# Altium project gocart.PrjPcb
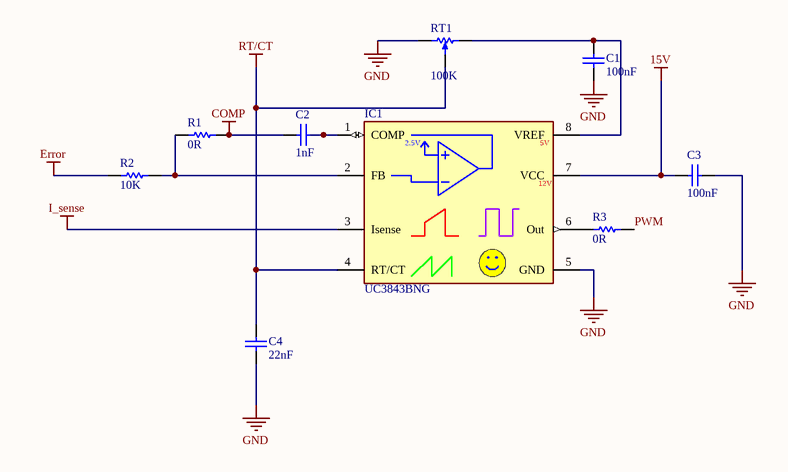
[diagram p0: current_mode_controller.SchDoc]
8 sheets, 87 parts. Net scope: global (net labels, ports and power ports of the same name join across sheets).
Board file: gocart.PcbDoc
Sheets:
  current_mode_controller.SchDoc
  volt_regulators.SchDoc
  brake_circuit.SchDoc
  accelerator.SchDoc
  i_sense.SchDoc
  test_points.SchDoc
  headers.SchDoc
  pwm_inverter.SchDoc

## Sheet current_mode_controller.SchDoc
size A4; SheetNumber: 1; SheetTotal: 8

### Parts
C1  100nF  [CAPC1608L]
C2  1nF  [CAPC1608L]
C3  100nF  [CAPC1608L]
C4  22nF  [CAPC1608L]
IC1  UC3843BNG  [DIP794W56P254L959H533Q8B]
R1  0R  [RESC1608L]
R2  10K  [RESC1608L]
R3  0R  [RESC1608L]
RT1  100K  [PVZ2A]

### Nets
15V: C3.1 IC1.7(VCC)
COMP: C2.1 R1.2
Error: R2.1
GND: C1.1 C3.2 C4.1 IC1.5(GND) RT1.3(-)
I_sense: IC1.3(Isense)
PWM: R3.2
RT/CT: C4.2 IC1.4(RT/CT) RT1.2(W)
NetC1_2: C1.2 IC1.8(VREF) RT1.1
NetC2_2: C2.2 IC1.1(COMP)
NetIC1_2: IC1.2(FB) R1.1 R2.2
NetIC1_6: IC1.6(Out) R3.1

### Notes on the sheet
- (in symbol UC3843BNG) 2.5V; 5V; 12V

### Library data of the parts
C1 C3 = CC_100nF_0603: CAP CER 100nF X7R +-10% 50V 0603; PackageReference: 0603; Code_IPC: 1608 [0603]; Verify: *; Supplier: ECE Dept; Storage Location: PCB Assembly WS; Value: 100nF
C2 = CC_1nF_0603: CAP CER 1nF X7R +-10% 50V 0603; PackageReference: 0603; Code_IPC: 1608 [0603]; Verify: *; Supplier: ECE Dept; Storage Location: PCB Assembly WS; Value: 1nF
C4 = CC_22nF_0603: CAP CER 22nF X7R +-10% 50V 0603; PackageReference: 0603; Code_IPC: 1608 [0603]; Verify: *; Supplier: ECE Dept; Storage Location: PCB Assembly WS; Value: 22nF
IC1 = UC3843BNG: Integrated Circuit; Manufacturer_Name: ON Semiconductor; Datasheet Link: http://www.onsemi.com/pub/Collateral/UC3842B-D.PDF; Height: 5.33mm; Manufacturer_Part_Number: UC3843BNG; Arrow Part Number: UC3843BNG; Arrow Price/Stock: https://www.arrow.com/en/products/uc3843bng/on-semiconductor; Mouser Part Number: 863-UC3843BNG; Mouser Price/Stock: https://www.mouser.co.uk/ProductDetail/ON-Semiconductor/UC3843BNG?qs=xZq1yRCsb1c8CkSt0UbHMA%3D%3D
R1 R3 = RS_0R0: RES 0.0 OHM 1/10W 5% 0603 SMD; Storage Location: PCB Assembly WS; Supplier: ECE Dept; Value: 0R
R2 = RS_10K: RES 10.0K OHM 1/10W 5% 0603 SMD; Storage Location: PCB Assembly WS; Supplier: ECE Dept; Value: 10K
RT1 = RM_100K: Trim Pot SMD 100K Murata PVZ2 Series SMD; Manufacturer Part Number: PVZ2A104C04B00; Adjustment Type: Top; External Depth: 2.7; External Length / Height: 0.85; External Width: 2.1; No. of Turns: 1; Power Rating: 50; Resistor Element Material: Metal Foil; Manufacturer: MURATA; Storage Location: PCB Assembly WS; Potentiometer Mounting: SMD; Series: PVZ2; Supplier 1: Farnell; Supplier Part Number 1: 1771728; Supplier: ECE Dept; Value: 100K

## Sheet volt_regulators.SchDoc
size A4; SheetNumber: 2; SheetTotal: 8
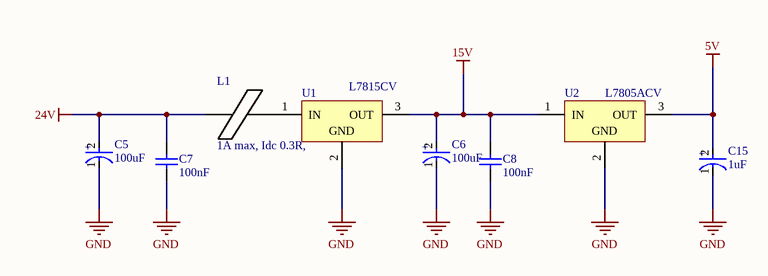
[diagram p1: volt_regulators.SchDoc]

### Parts
C5  100uF  [FP-ESLGM-MFG]
C6  100uF  [FP-ESLGM-MFG]
C7  100nF  [CAPC1608L]
C8  100nF  [CAPC1608L]
C15  1uF  [FP-UPW1E220MDD-MFG]
L1  1A max, Idc 0.3R,  [INDC3216L]
U1  L7815CV  [TO220]
U2  L7805ACV  [TO220]

### Nets
5V: C15.2(A) U2.3(OUT)
15V: C6.2(A) C8.2 U1.3(OUT) U2.1(IN)
24V: C5.2(A) C7.2 L1.1
GND: C5.1(C) C6.1(C) C7.1 C8.1 C15.1(C) U1.2(GND) U2.2(GND)
NetL1_2: L1.2 U1.1(IN)

### Notes on the sheet
- (in symbol CMP-03015-000005-1) +
- (in symbol CMP-12462-000010-1) +

### Library data of the parts
C5 C6 = CMP-03015-000005-1: CAP ALUM 100UF 20% 50V THRU HOLE. Part Number: ESL107M050AGMAA. Dia: 8mm.; Manufacturer: KEMET; Esr: 0.12Ω; Ripple Current: 725mA; Life: 10000Hours; Leakage Current: 50uA; Dissipation Factor: 10%; Material: Aluminum; Tolerance: 20%; Temperature Range High: +105°C; Automotive: No; Value: 100uF; Device Class L2: Capacitors; Lead Free: Yes; Octopart: https://octopart.com/esl107m050agmaa-kemet-84758890; Height: 13.5mm; ComponentLink2Description: Datasheet; Capacitance: 100uF; Package: ESLGM; RoHS: TRUE; Digikey Description: CAP ALUM 100UF 20% 50V THRU HOLE; Temperature Range Low: -40°C; Manufacturer Part Number: ESL107M050AGMAA; Device Class L1: Passive Components; Device Class L3: Aluminum Electrolytic Capacitors; Voltage Rating: 50V; Temperature: -40°C to +105°C; Category: Cap; ComponentLink2URL: https://content.kemet.com/datasheets/KEM_A4074_ESL.pdf; Manufacturer 1: KEMET; Manufacturer Part Number 1: ESL107M050AGMAA
C7 C8 = CC_100nF_0603: CAP CER 100nF X7R +-10% 50V 0603; PackageReference: 0603; Code_IPC: 1608 [0603]; Verify: *; Supplier: ECE Dept; Storage Location: PCB Assembly WS; Value: 100nF
C15 = CMP-12462-000010-1: CAP ALUM 22UF 20% 25V RADIAL. Part Number: UPW1E220MDD. Dia: 5mm.; Manufacturer: Nichicon; Leakage Current: 16.5uA; Ripple Current: 180mA; Life: 2000Hours; Dissipation Factor: 14%; Automotive Grade: Grade 2; Material: Aluminum; Voltage Rating: 25V; Device Class L1: Passive Components; ComponentLink2URL: https://products.nichicon.co.jp/en/pdf/XJA043/e-upw.pdf; Octopart: https://octopart.com/upw1e220mdd-nichicon-202818; RoHS: TRUE; Tolerance: 20%; Height: 12.5mm; Lead Free: Yes; Value: 22uF; Category: Cap; Temperature Range Low: -55°C; Device Class L3: Aluminum Electrolytic Capacitors; Package: 0; Manufacturer Part Number: UPW1E220MDD; Capacitance: 22uF; Automotive: Yes; Digikey Description: CAP ALUM 22UF 20% 25V RADIAL; Temperature: -55°C to +105°C; Device Class L2: Capacitors; ComponentLink2Description: Datasheet; Temperature Range High: +105°C; Manufacturer 1: Nichicon; Manufacturer Part Number 1: UPW1E220MDD
L1 = IN_Ferrite-Bead: Ferrite Bead, Rdc 0.3R, Z100MHZ 600R, Imax 1A, SMD 1206; Manufacturer: FAIR-RITE; Manufacturer PN: 2512066017Y1; DC Current Rating: 1; DC Resistance Max: 0.08; Ferrite Case Style: 1206 ^3216 Metric]; Frequency Range: 50MHz to 1; Impedance: 600; Impedance Tolerance: ± 25%; Supplier: ECE Dept; Storage Location: PCB Assembly WS; Ferrite Mounting: SMD; Supplier 1: Farnell; Supplier Part Number 1: 1612060; Manufacturer Part Number: 2512066017Y1; Value: 1A max, Idc 0.3R,
U1 = CMP-0244-00422-1: Positive Voltage Regulator, 15V, 3-Pin TO-220; Manufacturer 1: STMicroelectronics; ComponentLink1Description: Manufacturer URL; ComponentLink3URL: http://www.st.com/internet/com/TECHNICAL_RESOURCES/TECHNICAL_LITERATURE/PACKAGE_INFORMATION/CD00004649.pdf; ComponentLink3Description: Package Specification; ComponentLink1URL: http://www.st.com; ComponentLink2Description: Datasheet; DatasheetVersion: 16/11/2011; ComponentLink2URL: http://www.st.com/internet/com/TECHNICAL_RESOURCES/TECHNICAL_LITERATURE/DATASHEET/CD00000444.pdf; PackageVersion: ver3.0; PackageDescription: TO, Thru-Hole, Vertical, Heatsink Mounted; 3 In-Line Leads; Pitch 2.54 mm; PackageReference: TO220; Manufacturer Part Number 1: L7815CV
U2 = CMP-0244-00484-1: Positive Voltage Regulator, 5V, 3-Pin TO-220; Manufacturer 1: STMicroelectronics; DatasheetVersion: 16/11/2011; ComponentLink2Description: Datasheet; ComponentLink3Description: Package Specification; ComponentLink2URL: http://www.st.com/internet/com/TECHNICAL_RESOURCES/TECHNICAL_LITERATURE/DATASHEET/CD00000444.pdf; PackageDescription: TO, Thru-Hole, Vertical, Heatsink Mounted; 3 In-Line Leads; Pitch 2.54 mm; ComponentLink3URL: http://www.st.com/internet/com/TECHNICAL_RESOURCES/TECHNICAL_LITERATURE/PACKAGE_INFORMATION/CD00004649.pdf; PackageReference: TO220; ComponentLink1URL: http://www.st.com; PackageVersion: ver3.0; ComponentLink1Description: Manufacturer URL; Manufacturer Part Number 1: L7805ACV

## Sheet brake_circuit.SchDoc
size A4; SheetNumber: 3; SheetTotal: 8
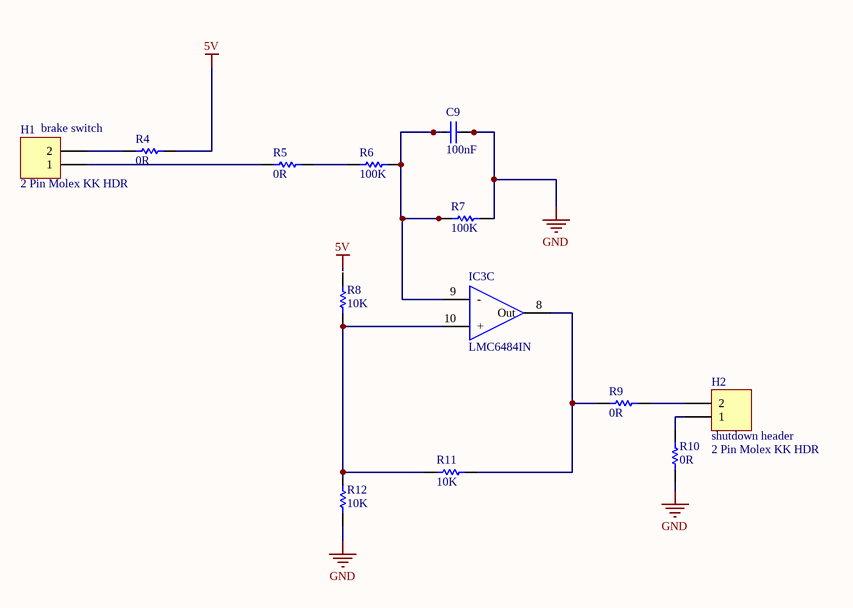
[diagram p2: brake_circuit.SchDoc]

### Parts
C9  100nF  [CAPC1608L]
H1  brake switch  value 2 Pin Molex KK HDR  [MOLEX_KK_2_HDR]
H2  shutdown header  value 2 Pin Molex KK HDR  [MOLEX_KK_2_HDR]
IC3  LMC6484IN  [DIP794W56P254L1905H533Q14N]  (part C of 4)
R4  0R  [RESC1608L]
R5  0R  [RESC1608L]
R6  100K  [RESC1608L]
R7  100K  [RESC1608L]
R8  10K  [RESC1608L]
R9  0R  [RESC1608L]
R10  0R  [RESC1608L]
R11  10K  [RESC1608L]
R12  10K  [RESC1608L]

### Nets
5V: R4.2
GND: C9.2 R7.2 R10.1 R12.1
NetC9_1: C9.1 IC3.9(-) R6.2 R7.1
NetH1_1: H1.1 R5.1
NetH1_2: H1.2 R4.1
NetH2_1: H2.1 R10.2
NetH2_2: H2.2 R9.2
NetIC3_8: IC3.8(Out) R9.1 R11.1
NetIC3_10: IC3.10(+) R8.1 R11.2 R12.2
NetR5_2: R5.2 R6.1

Not connected (* = marked no-connect by the designer): R8 2

### Library data of the parts
C9 = CC_100nF_0603: CAP CER 100nF X7R +-10% 50V 0603; PackageReference: 0603; Code_IPC: 1608 [0603]; Verify: *; Supplier: ECE Dept; Storage Location: PCB Assembly WS; Value: 100nF
H1 = JA_MOLEX_KK_2POS: Supplier 1: Farnell; Supplier Part Number 1: 1462926; Supplier: ECE Dept; Storage Location: ECE Dept Store
H2 = JA_MOLEX_KK_2POS: CONN HEADER 2POS 2.54mm VERT_Thru Hole; Supplier 1: Farnell; Supplier Part Number 1: 1462926; Supplier: ECE Dept; Storage Location: ECE Dept Store
IC3 = LMC6484IN: Integrated Circuit; Manufacturer_Name: Texas Instruments; Datasheet Link: http://www.ti.com/lit/gpn/lmc6484; Height: 5.334mm; Manufacturer_Part_Number: LMC6484IN; Arrow Part Number: LMC6484IN; Mouser Part Number: 926-LMC6484IN; Mouser Price/Stock: https://www.mouser.com/Search/Refine.aspx?Keyword=926-LMC6484IN
R4 R5 R9 R10 = RS_0R0: RES 0.0 OHM 1/10W 5% 0603 SMD; Storage Location: PCB Assembly WS; Supplier: ECE Dept; Value: 0R
R6 R7 = RS_100K: RES 100K OHM 1/10W 5% 0603 SMD; Storage Location: PCB Assembly WS; Supplier: ECE Dept; Value: 100K
R8 R11 R12 = RS_10K: RES 10.0K OHM 1/10W 5% 0603 SMD; Storage Location: PCB Assembly WS; Supplier: ECE Dept; Value: 10K

## Sheet accelerator.SchDoc
size A4; SheetNumber: 4; SheetTotal: 8
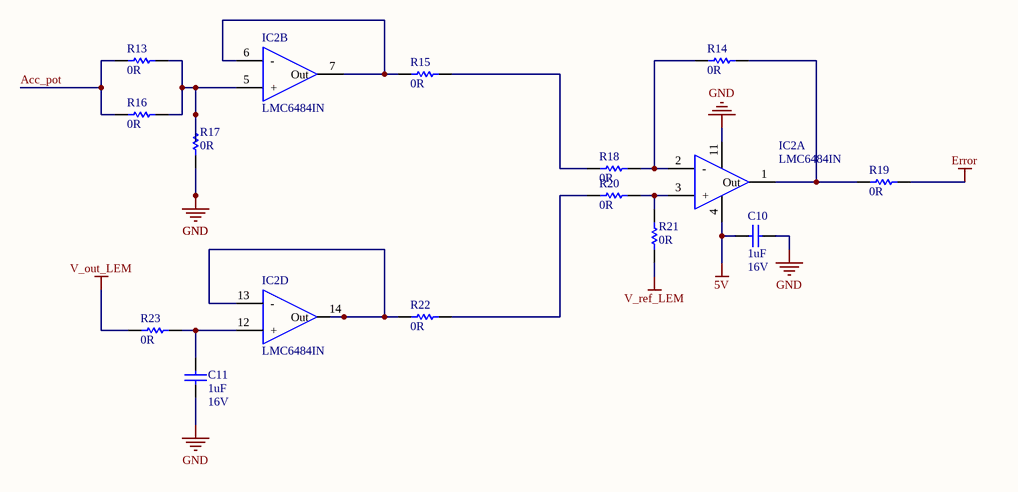
[diagram p3: accelerator.SchDoc]

### Parts
C10  Max Voltage: 16V  [CAPC1608L]  (hidden comment: 1uF)
C11  Max Voltage: 16V  [CAPC1608L]  (hidden comment: 1uF)
IC2  LMC6484IN  [DIP794W56P254L1905H533Q14N]  (parts A,B,D of 4)
R13  0R  [RESC1608L]
R14  0R  [RESC1608L]
R15  0R  [RESC1608L]
R16  0R  [RESC1608L]
R17  0R  [RESC1608L]
R18  0R  [RESC1608L]
R19  0R  [RESC1608L]
R20  0R  [RESC1608L]
R21  0R  [RESC1608L]
R22  0R  [RESC1608L]
R23  0R  [RESC1608L]

### Nets
5V: C10.2 IC2.4(Vcc)
Acc_pot: R13.1 R16.1
Error: R19.1
GND: C10.1 C11.1 IC2.11(-Vcc) R17.2
V_out_LEM: R23.1
V_ref_LEM: R21.2
NetC11_2: C11.2 IC2.12(+) R23.2
NetIC2_1: IC2.1(Out) R14.1 R19.2
NetIC2_2: IC2.2(-) R14.2 R18.1
NetIC2_3: IC2.3(+) R20.1 R21.1
NetIC2_5: IC2.5(+) R13.2 R16.2 R17.1
NetIC2_6: IC2.6(-) IC2.7(Out) R15.2
NetIC2_13: IC2.13(-) IC2.14(Out) R22.2
NetR15_1: R15.1 R18.2
NetR20_2: R20.2 R22.1

### Library data of the parts
C10 C11 = CC_1uF_0603: CAP CER 1uF Y5V -20% +80% 16V 0603; PackageReference: 0603; Code_IPC: 1608 [0603]; Verify: *; Supplier: ECE Dept; Storage Location: PCB Assembly WS; Value: 1uF
IC2 = LMC6484IN: as IC3 on sheet brake_circuit; Datasheet Link: http://www.ti.com/lit/gpn/lmc6484; Height: 5.334mm; Manufacturer_Part_Number: LMC6484IN; Arrow Part Number: LMC6484IN; Mouser Part Number: 926-LMC6484IN; Mouser Price/Stock: https://www.mouser.com/Search/Refine.aspx?Keyword=926-LMC6484IN
R13-R23 = RS_0R0: RES 0.0 OHM 1/10W 5% 0603 SMD; Storage Location: PCB Assembly WS; Supplier: ECE Dept; Value: 0R

## Sheet i_sense.SchDoc
size A4; SheetNumber: 5; SheetTotal: 8
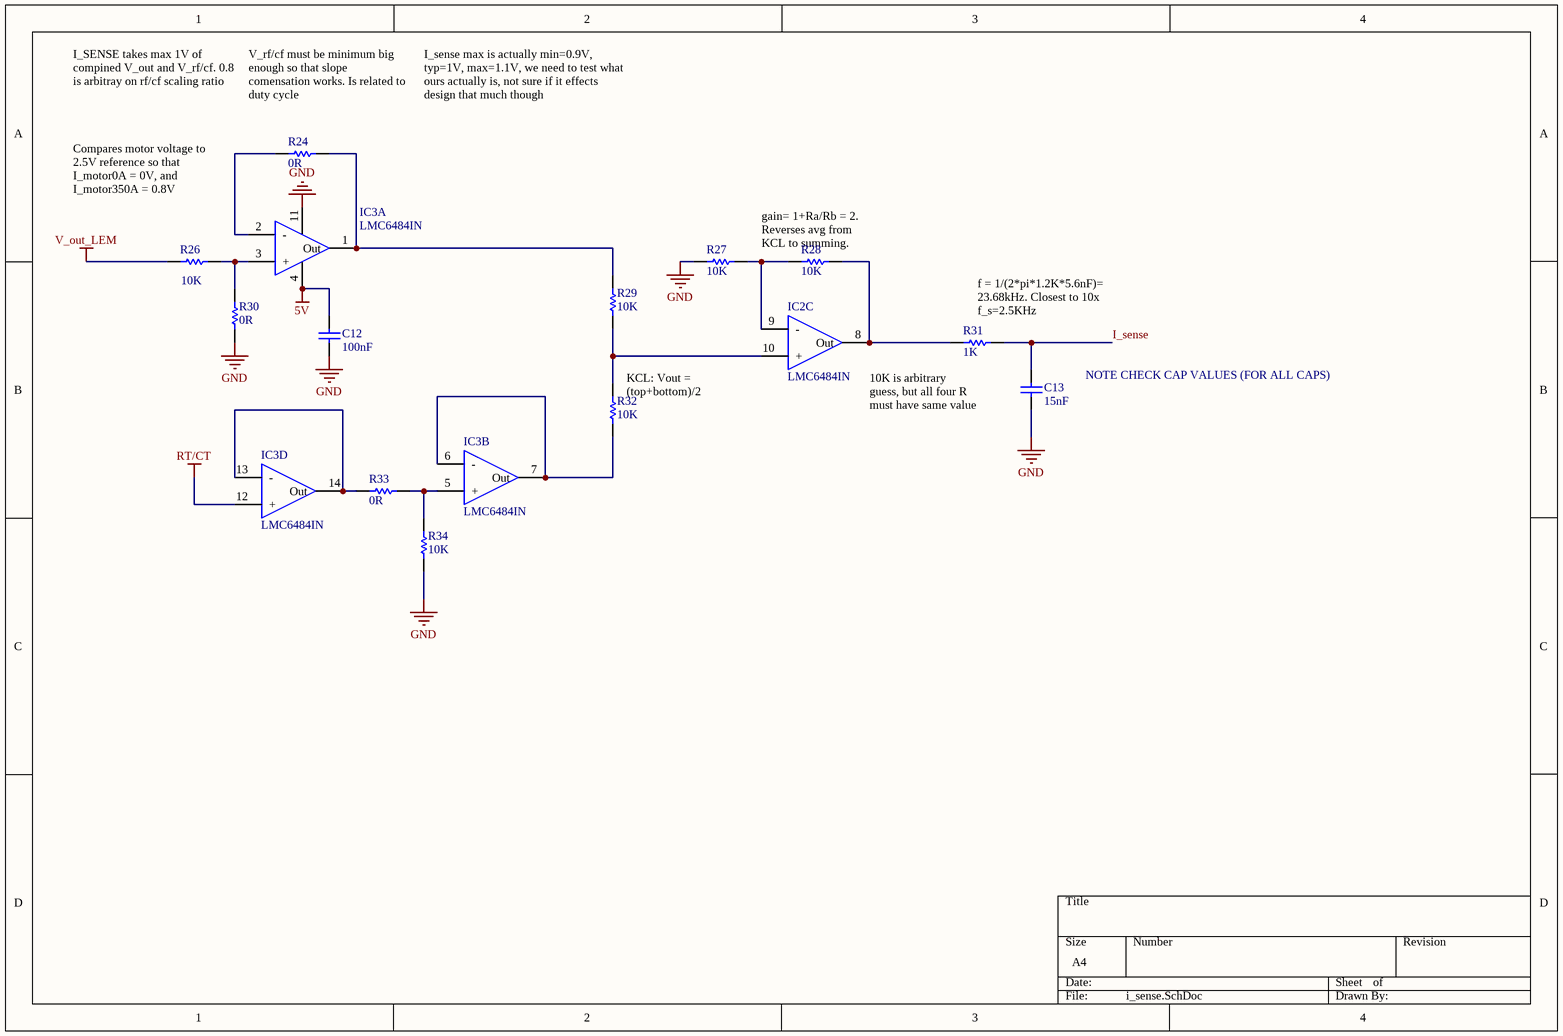
[diagram p4: i_sense.SchDoc]

### Parts
C12  100nF  [CAPC1608L]
C13  15nF  [CAPC1608L]
IC2  LMC6484IN  [DIP794W56P254L1905H533Q14N]  (part C of 4)
IC3  LMC6484IN  [DIP794W56P254L1905H533Q14N]  (parts A,B,D of 4)
R24  0R  [RESC1608L]
R26  10K  [RESC1608L]
R27  10K  [RESC1608L]
R28  10K  [RESC1608L]
R29  10K  [RESC1608L]
R30  0R  [RESC1608L]
R31  1K  [RESC1608L]
R32  10K  [RESC1608L]
R33  0R  [RESC1608L]
R34  10K  [RESC1608L]

### Nets
5V: C12.2 IC3.4(Vcc)
GND: C12.1 C13.1 IC3.11(-Vcc) R27.1 R30.1 R34.1
I_sense: C13.2 R31.2
RT/CT: IC3.12(+)
V_out_LEM: R26.1
NetIC2_8: IC2.8(Out) R28.2 R31.1
NetIC2_9: IC2.9(-) R27.2 R28.1
NetIC2_10: IC2.10(+) R29.1 R32.2
NetIC3_1: IC3.1(Out) R24.2 R29.2
NetIC3_2: IC3.2(-) R24.1
NetIC3_3: IC3.3(+) R26.2 R30.2
NetIC3_5: IC3.5(+) R33.2 R34.2
NetIC3_6: IC3.6(-) IC3.7(Out) R32.1
NetIC3_13: IC3.13(-) IC3.14(Out) R33.1

### Notes on the sheet
- I_SENSE takes max 1V of compined V_out and V_rf/cf. 0.8 is arbitray on rf/cf scaling ratio
- (near R24) V_rf/cf must be minimum big enough so that slope comensation works. Is related to duty cycle
- I_sense max is actually min=0.9V, typ=1V, max=1.1V, we need to test what ours actually is, not sure if it effects design that much though
- Compares motor voltage to 2.5V reference so that I_motor0A = 0V, and I_motor350A = 0.8V
- (near R28) gain= 1+Ra/Rb = 2. Reverses avg from KCL to summing.
- (near R31) f = 1/(2*pi*1.2K*5.6nF)= 23.68kHz. Closest to 10x f_s=2.5KHz
- NOTE CHECK CAP VALUES (FOR ALL CAPS)
- (near R32) KCL: Vout = (top+bottom)/2
- 10K is arbitrary guess, but all four R must have same value

### Library data of the parts
C12 = CC_100nF_0603: CAP CER 100nF X7R +-10% 50V 0603; PackageReference: 0603; Code_IPC: 1608 [0603]; Verify: *; Supplier: ECE Dept; Storage Location: PCB Assembly WS; Value: 100nF
C13 = CC_15nF_0603: CAP CER 15nF X7R +-10% 50V 0603; PackageReference: 0603; Code_IPC: 1608 [0603]; Verify: *; Supplier: ECE Dept; Storage Location: PCB Assembly WS; Value: 15nF
IC2 IC3 = LMC6484IN: as IC3 on sheet brake_circuit; Datasheet Link: http://www.ti.com/lit/gpn/lmc6484; Height: 5.334mm; Manufacturer_Part_Number: LMC6484IN; Arrow Part Number: LMC6484IN; Mouser Part Number: 926-LMC6484IN; Mouser Price/Stock: https://www.mouser.com/Search/Refine.aspx?Keyword=926-LMC6484IN
R24 R30 R33 = RS_0R0: RES 0.0 OHM 1/10W 5% 0603 SMD; Storage Location: PCB Assembly WS; Supplier: ECE Dept; Value: 0R
R26-R29 R32 R34 = RS_10K: RES 10.0K OHM 1/10W 5% 0603 SMD; Storage Location: PCB Assembly WS; Supplier: ECE Dept; Value: 10K
R31 = RS_1K: RES 1.0K OHM 1/10W 5% 0603 SMD; Storage Location: PCB Assembly WS; Supplier: ECE Dept; Value: 1K

## Sheet test_points.SchDoc
size A4; SheetNumber: 6; SheetTotal: 8
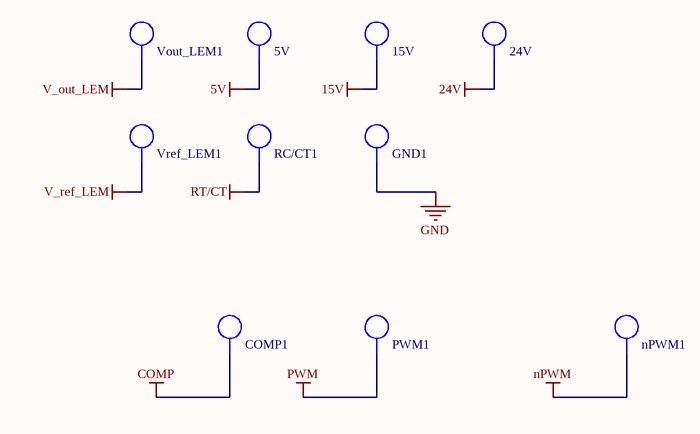
[diagram p5: test_points.SchDoc]

### Parts
5V  TP  [TP_1206]  (value not drawn)  (no BOM)
15V  TP  [TP_1206]  (value not drawn)  (no BOM)
24V  TP  [TP_1206]  (value not drawn)  (no BOM)
COMP1  TP  [TP_1206]  (value not drawn)  (no BOM)
GND1  TP  [TP_1206]  (value not drawn)  (no BOM)
nPWM1  TP  [TP_1206]  (value not drawn)  (no BOM)
PWM1  TP  [TP_1206]  (value not drawn)  (no BOM)
RC/CT1  TP  [TP_1206]  (value not drawn)  (no BOM)
Vout_LEM1  TP  [TP_1206]  (value not drawn)  (no BOM)
Vref_LEM1  TP  [TP_1206]  (value not drawn)  (no BOM)

### Nets
5V: 5V.1
15V: 15V.1
24V: 24V.1
COMP: COMP1.1
GND: GND1.1
nPWM: nPWM1.1
PWM: PWM1.1
RT/CT: RC/CT1.1
V_out_LEM: Vout_LEM1.1
V_ref_LEM: Vref_LEM1.1

### Library data of the parts
5V 15V 24V COMP1 GND1 nPWM1 PWM1 RC/CT1 Vout_LEM1 Vref_LEM1 = TP_1206: Test-Point 3.3x1.6x2.1mm SMD; Manufacturer: Harwin Inc; Manufacturer Part Number: S1751-46R; Manufacturer PN: *; Storage Location: ProtoPlace; Mounting Type: Surface Mount; Type: PC Test Point; Supplier 1: Digi-Key; Supplier Part Number 1: 952-1478-2-ND; Supplier 2: Farnell; Supplier Part Number 2: 1826282; Supplier: ECE Dept; Value: TP

## Sheet headers.SchDoc
size A4; SheetNumber: 7; SheetTotal: 8
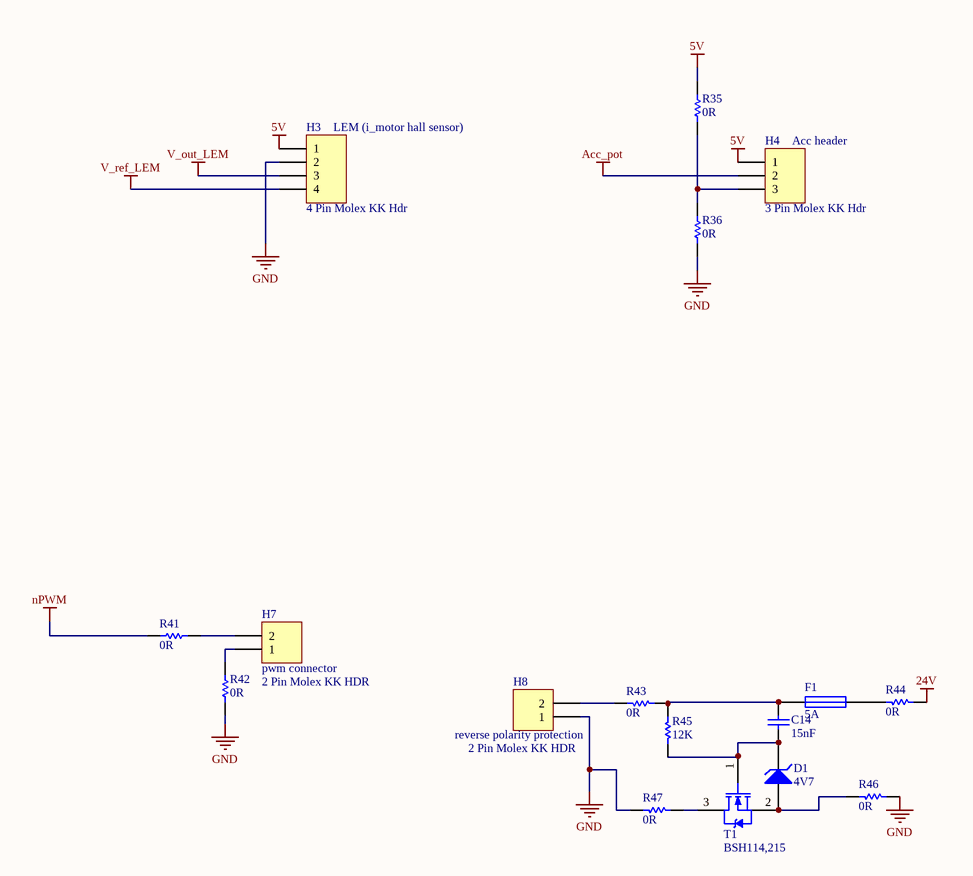
[diagram p6: headers.SchDoc]

### Parts
C14  15nF  [CAPC1608L]
D1  4V7  [SOT23_L]
F1  5A  [RESC3216N]
H3  LEM (i_motor hall sensor)  value 4 Pin Molex KK Hdr  [MOLEX_KK_4_HDR]
H4  Acc header  value 3 Pin Molex KK Hdr  [MOLEX_KK_3_HDR]
H7  pwm connector  value 2 Pin Molex KK HDR  [MOLEX_KK_2_HDR]
H8  reverse polarity protection  value 2 Pin Molex KK HDR  [MOLEX_KK_2_HDR]
R35  0R  [RESC1608L]
R36  0R  [RESC1608L]
R41  0R  [RESC1608L]
R42  0R  [RESC1608L]
R43  0R  [RESC1608L]
R44  0R  [RESC1608L]
R45  12K  [RESC1608L]
R46  0R  [RESC1608L]
R47  0R  [RESC1608L]
T1  BSH114,215  [SOT23_L]

### Nets
5V: H3.1 H4.1 R35.2
24V: R44.1
Acc_pot: H4.2
GND: H3.2 H8.1 R36.1 R42.1 R46.1 R47.2
nPWM: R41.1
V_out_LEM: H3.3
V_ref_LEM: H3.4
NetC14_1: C14.1 D1.3(K) R45.2 T1.1
NetC14_2: C14.2 F1.1 R43.1 R45.1
NetD1_1: D1.1(A) R46.2 T1.2
NetF1_2: F1.2 R44.2
NetH4_3: H4.3 R35.1 R36.2
NetH7_1: H7.1 R42.2
NetH7_2: H7.2 R41.2
NetH8_2: H8.2 R43.2
NetR47_1: R47.1 T1.3

### Library data of the parts
C14 = CC_15nF_0603: CAP CER 15nF X7R +-10% 50V 0603; PackageReference: 0603; Code_IPC: 1608 [0603]; Verify: *; Supplier: ECE Dept; Storage Location: PCB Assembly WS; Value: 15nF
D1 = DZ_4.7V: BZX84C4V7LT1G - DIODE, ZENER, 4.7V, 225MW, SOT23; Manufacturer: ON SEMICONDUCTOR; Breakdown Voltage Max: 5; Breakover Voltage Min: 4.7; Diode Case Style: SOT-23; Power Dissipation Pd: 225; Supplier 1: Farnell; Supplier 2: Digi-Key; Supplier Part Number 1: 1459051; Supplier Part Number 2: BZX84C4V7LT1GOSCT-ND; Manufacturer Part Number: BZX84C4V7LT1G
F1 = FS_Fuse_5.0A: Fuse 5.0A Fast Acting 1206 SMD; Manufacturer: Bel TRP; Manufacturer Part Number: C1F5; Voltage Rating (AC): 125V; Voltage Rating (DC): 63V; DC Cold Resistance: 19mR; Fuse Type: Board Mount (Cartridge Style Excluded); Approvals: CE,cURus; Supplier 1: Digi-Key; Supplier 2: Element14; Current Rating: 5A; Supplier Part Number 2: 2848595; Supplier Part Number 1: 507-1886-1-ND; Value: 5A; Mount: Surface Mount; Case/Package: 1206; Number of Pins: 2; Case Code (Metric): 3216; Case Code (Imperial): 1206; Contact Plating: Nickel,Tin; Min Operating Temperature: -55°C; Max Operating Temperature: 125°C; Packaging: Tape and Reel; Voltage Rating: 125V; Length: 0.126inch; Width: 0.062inch; Stock 1: 725; Pricing 1: 1=0.32, 5=0.312, 10=0.298, 50=0.2662, 100=0.2479, 250=0.22032, 500=0.1836, 1000=0.17442 (USD); ComponentLink1URL: http://www.farnell.com/datasheets/2571625.pdf; ComponentLink1Description: http://www.farnell.com/datasheets/2571625.pdf; ComponentLink2URL: http://belfuse.com/pdfs/C1F.pdf; ComponentLink2Description: http://belfuse.com/pdfs/C1F.pdf; ComponentLink3URL: http://www.mouser.com/ds/2/643/C1F-594910.pdf; ComponentLink3Description: http://www.mouser.com/ds/2/643/C1F-594910.pdf; ComponentLink4URL: https://belfuse.com/resources/StewartConnector/C1F.pdf; ComponentLink4Description: https://belfuse.com/resources/StewartConnector/C1F.pdf
H3 = JA_MOLEX_KK_4POS: CONN HEADER 4POS 2.54mm VERT_Thru Hole; Manufacturer: Molex; Manufacturer PN: 22-23-2041; Supplier Part Number 1: 9731164; Supplier: ECE Dept; Supplier 1: Farnell; Storage Location: ECE Dept Store
H4 = JA_MOLEX_KK_3POS: CONN HEADER 3POS 2.54mm VERT_Thru Hole; Manufacturer: Molex; Manufacturer PN: 22-23-2031; Supplier Part Number 1: 9731156; Supplier: ECE Dept; Supplier 1: Farnell; Storage Location: ECE Dept Store
H7 H8 = JA_MOLEX_KK_2POS: CONN HEADER 2POS 2.54mm VERT_Thru Hole; Supplier 1: Farnell; Supplier Part Number 1: 1462926; Supplier: ECE Dept; Storage Location: ECE Dept Store
R35 R36 R41-R47 = RS_0R0: RES 0.0 OHM 1/10W 5% 0603 SMD; Storage Location: PCB Assembly WS; Supplier: ECE Dept
  R35 R36 R41-R44 R46 R47: Value: 0R
  R45: Value: 12K
T1 = TM_BSH114: MOSFET N-CH 100V 0.85A SOT-23; Continuous Drain Current Id: 500; Current Id Max: 850; Drain Source Voltage Vds: 100; Power Dissipation Pd: 830; Transistor Type: Enhancement; Voltage Vds Typ: 130; Voltage Vgs Max: 3; Voltage Vgs Rds on Measurement: 10; Transistor Case Style: SOT-23; Supplier 1: Farnell; Supplier Part Number 1: 1758071RL; Manufacturer Part Number: BSH114,215

## Sheet pwm_inverter.SchDoc
size A4; SheetNumber: 8; SheetTotal: 8
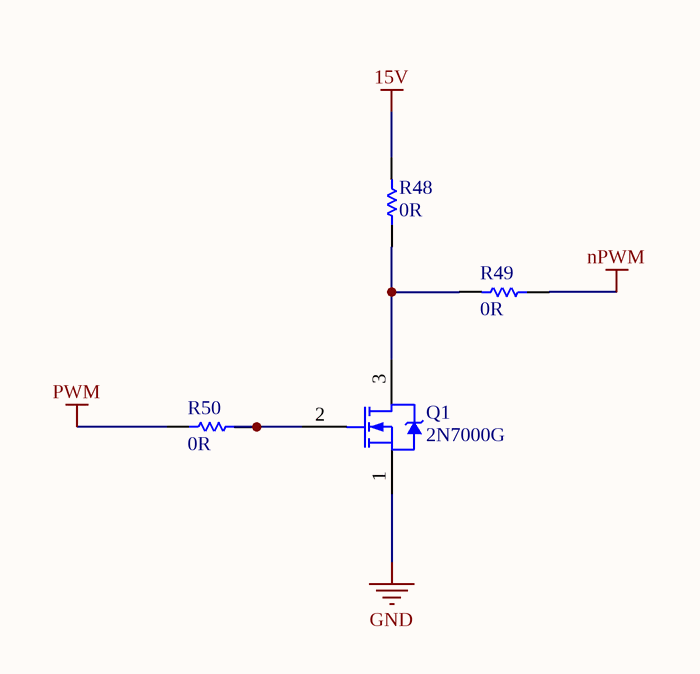
[diagram p7: pwm_inverter.SchDoc]

### Parts
Q1  2N7000G  [ONSC-TO-92-3-29-11]
R48  0R  [RESC1608L]
R49  0R  [RESC1608L]
R50  0R  [RESC1608L]

### Nets
15V: R48.2
GND: Q1.1(S)
nPWM: R49.1
PWM: R50.1
NetQ1_2: Q1.2(G) R50.2
NetQ1_3: Q1.3(D) R48.1 R49.2

### Library data of the parts
Q1 = CMP-1058-00937-1: Small Signal MOSFET, 200 mA, 60 V, N-Channel, 3-Pin TO-92, Pb-Free, Bulk Box; Manufacturer: On Semiconductor; Coss Typ (pF): 25; ID Max (A): 0.2; Ciss Typ (pF): 60; VGS(th) Max (V): 3; PD Max (W): 0.35; Configuration: Single; Channel Polarity: N Channel; VGS Max (V): 20; Crss Typ (pF): 5; RoHS: Pb-Free; PackageVersion: Rev. AM; Mounting Technology: Through Hole; PackageReference: TO-92-3-29-11_AM_SL; ComponentLink1Description: Manufacturer URL; PartNumber: 2N7000G; Package Type: TO-92; ComponentLink3Description: Package Specification; ComponentLink2Description: Datasheet; ComponentLink3URL: http://www.onsemi.cn/pub_link/Collateral/2N6426-D.PDF; DatasheetVersion: Rev. 8; Packing: Bulk Box; PackageDescription: 3-Pin Transistor Outline, Body 4.825 x 3.685 mm, Pitch 1.27 mm; ComponentLink1URL: http://www.onsemi.com/; V(BR)DSS Min (V): 60; ComponentLink2URL: http://www.onsemi.com/pub_link/Collateral/2N7000-D.PDF; Manufacturer 1: ON Semiconductor; Manufacturer Part Number 1: 2N7000G
R48-R50 = RS_0R0: RES 0.0 OHM 1/10W 5% 0603 SMD; Storage Location: PCB Assembly WS; Supplier: ECE Dept; Value: 0R

## Nets that join several sheets
5V: volt_regulators (C15.2 U2.3), brake_circuit (R4.2), accelerator (C10.2 IC2.4), i_sense (C12.2 IC3.4), test_points (5V.1), headers (H3.1 H4.1 R35.2)
15V: current_mode_controller (C3.1 IC1.7), volt_regulators (C6.2 C8.2 U1.3 U2.1), test_points (15V.1), pwm_inverter (R48.2)
24V: volt_regulators (C5.2 C7.2 L1.1), test_points (24V.1), headers (R44.1)
Acc_pot: accelerator (R13.1 R16.1), headers (H4.2)
COMP: current_mode_controller (C2.1 R1.2), test_points (COMP1.1)
Error: current_mode_controller (R2.1), accelerator (R19.1)
GND: current_mode_controller (5 pins), volt_regulators (7 pins), brake_circuit (C9.2 R7.2 R10.1 R12.1), accelerator (C10.1 C11.1 IC2.11 R17.2), i_sense (6 pins), test_points (GND1.1), headers (6 pins), pwm_inverter (Q1.1)
I_sense: current_mode_controller (IC1.3), i_sense (C13.2 R31.2)
nPWM: test_points (nPWM1.1), headers (R41.1), pwm_inverter (R49.1)
PWM: current_mode_controller (R3.2), test_points (PWM1.1), pwm_inverter (R50.1)
RT/CT: current_mode_controller (C4.2 IC1.4 RT1.2), i_sense (IC3.12), test_points (RC/CT1.1)
V_out_LEM: accelerator (R23.1), i_sense (R26.1), test_points (Vout_LEM1.1), headers (H3.3)
V_ref_LEM: accelerator (R21.2), test_points (Vref_LEM1.1), headers (H3.4)